# Altium project flexible-hand-warmer-left.PrjPcb
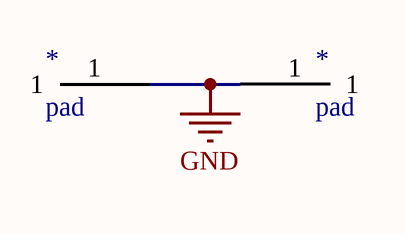
[diagram p0: Sheet1.SchDoc]
1 sheet, 2 parts. Net scope: global (net labels, ports and power ports of the same name join across sheets).
Board file: flexible-hand-warmer-left.PcbDoc

## Sheet Sheet1.SchDoc
size A4

### Parts
(Parts that share a designator on the sheet are numbered #1, #2 ... from top to bottom, then left to right.)
*#1  pad  [pad]
*#2  pad  [pad]

### Nets
GND: *#1.1 *#2.1